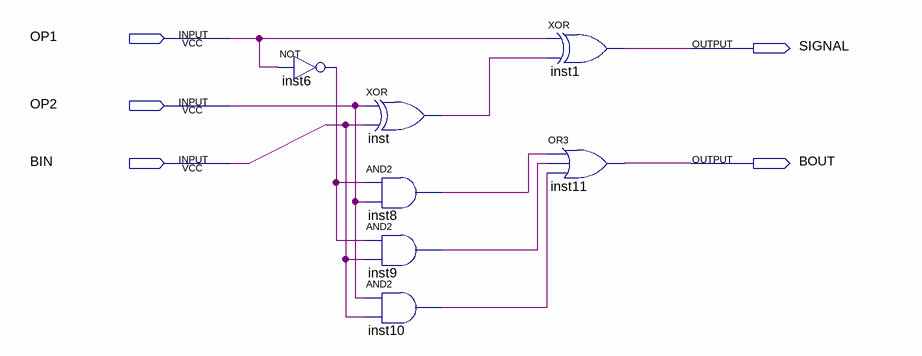
[diagram p0: schematic sheet]
// Quartus schematic sub1.bdf as structural Verilog: 7 symbols, 5 pins
module sub1 (
  input  OP1,
  input  OP2,
  input  BIN,
  output SIGNAL,
  output BOUT
);

  wire inst6_out, inst8_out, inst9_out, inst10_out, inst_out;

  not inst6 (inst6_out, OP1);
  xor inst (inst_out, OP2, BIN);
  and inst8 (inst8_out, inst6_out, OP2);
  and inst9 (inst9_out, inst6_out, BIN);
  and inst10 (inst10_out, OP2, BIN);
  xor inst1 (SIGNAL, OP1, inst_out);
  or inst11 (BOUT, inst8_out, inst9_out, inst10_out);
endmodule
